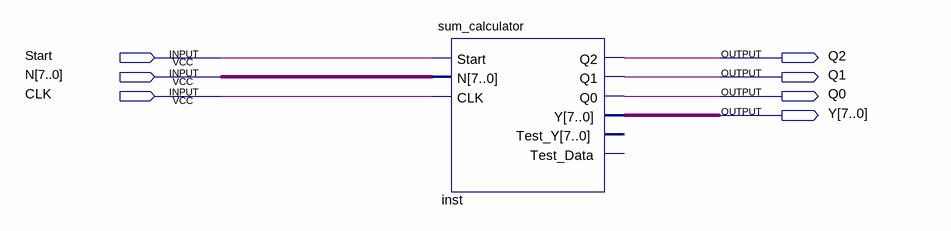
[diagram p0: schematic sheet]
// Quartus schematic cau01_circuit.bdf as structural Verilog: 1 symbols, 7 pins
module cau01_circuit (
  input  Start,
  input  [7:0] N,
  input  CLK,
  output Q2,
  output Q1,
  output Q0,
  output [7:0] Y
);

  sum_calculator inst (.Start(Start), .N(N), .CLK(CLK), .Q2(Q2), .Q1(Q1), .Q0(Q0), .Y(Y));  // open: Test_Y, Test_Data
endmodule
